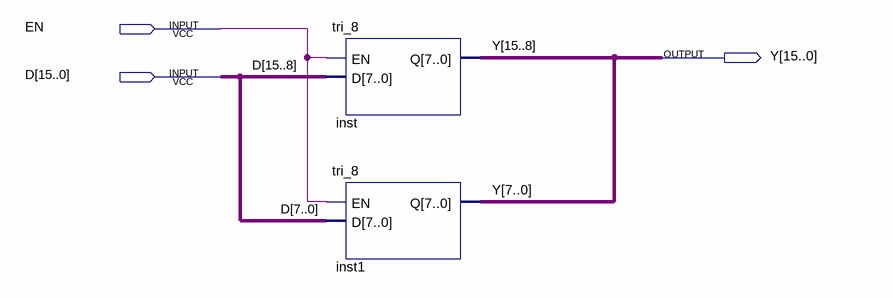
[diagram p0: schematic sheet]
// Quartus schematic tri_16.bdf as structural Verilog: 2 symbols, 3 pins
module tri_16 (
  input  EN,
  input  [15:0] D,
  output [15:0] Y
);

  tri_8 inst (.EN(EN), .D(D[15:8]), .Q(Y[15:8]));
  tri_8 inst1 (.EN(EN), .D(D[7:0]), .Q(Y[7:0]));
endmodule
